# Altium project Portable_Guitar_MultiFX.PrjPcb
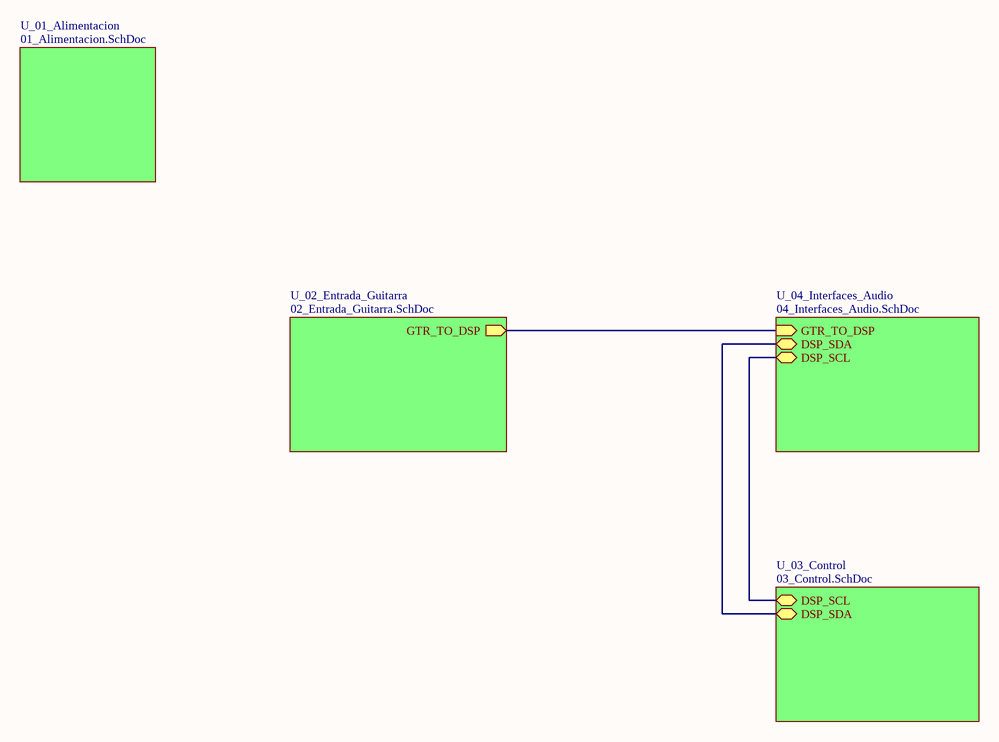
[diagram p0: 00_main.SchDoc]
5 sheets, 67 parts. Net scope: hierarchical (ports join the sheet entries above them; power ports are global).
Board file: Portable_Guitar_MultiFX.PcbDoc
Sheets:
  00_main.SchDoc
    U_02_Entrada_Guitarra = 02_Entrada_Guitarra.SchDoc
    U_04_Interfaces_Audio = 04_Interfaces_Audio.SchDoc
    U_03_Control = 03_Control.SchDoc
    U_01_Alimentacion = 01_Alimentacion.SchDoc

## Sheet 00_main.SchDoc: Portable_Guitar_MultiFX
size A4; Author: Javier Estiven Leon Calderon; Organization: Altium Limited; Address1: L3, 12a Rodborough Rd; Address2: Frenchs Forest; Address3: NSW; Address4: Australia 2086; DocumentNumber: 1; Revision: 1.0; SheetNumber: 1; SheetTotal: 5

### Sub-sheets
U_01_Alimentacion = 01_Alimentacion.SchDoc: no entries
U_02_Entrada_Guitarra = 02_Entrada_Guitarra.SchDoc: GTR_TO_DSP (out)
U_03_Control = 03_Control.SchDoc: DSP_SCL (bidir), DSP_SDA (bidir)
U_04_Interfaces_Audio = 04_Interfaces_Audio.SchDoc: GTR_TO_DSP (in), DSP_SDA (bidir), DSP_SCL (bidir)

### Nets
NetC8_2: sheet U_02_Entrada_Guitarra/GTR_TO_DSP, sheet U_04_Interfaces_Audio/GTR_TO_DSP
NetJP4_2: sheet U_04_Interfaces_Audio/DSP_SCL, sheet U_03_Control/DSP_SCL
NetJP5_2: sheet U_04_Interfaces_Audio/DSP_SDA, sheet U_03_Control/DSP_SDA

### Notes on the sheet
- Title
- Size:
- Date:
- A4
- Number:
- Time:
- Revision:
- Sheet
- of
- File:

## Sheet 02_Entrada_Guitarra.SchDoc: Portable_Guitar_MultiFX
size A4; Organization: Altium Limited; Address1: L3, 12a Rodborough Rd; Address2: Frenchs Forest; Address3: NSW; Address4: Australia 2086; DocumentNumber: 1; Revision: 1.0; SheetNumber: 3; SheetTotal: 5; SPICEModelCachePUIILNWP: <root> / <DocumentId>PUIILNWP</DocumentId> / <CacheFrame Number="0"> / <Model Name="mcp6001" Kind="CKT"> / <Text>.SUBCKT MCP6001 1 2 3 4 5 / *               | | | | | / *               | | | | Output / *               | | | Negative Supply / *               | | Positive Supply / *               | Inverting Input / *               Non-inverting Input / * / ******************************************************************************** / * Software License Agreement                                                   * / *                                                                              * / * The software supplied herewith by Microchip Technology Incorporated (the     * / * "Company") is intended and supplied to you, the Company's customer, for use  * / * soley and exclusively on Microchip products.                                 * / *                                                                              * / * The software is owned by the Company and/or its supplier, and is protected   * / * under applicable copyright laws. All rights are reserved. Any use in         * / * violation of the foregoing restrictions may subject the user to criminal     * / * sanctions under applicable laws, as well as to civil liability for the       * / * breach of the terms and conditions of this license.                          * / *                                                                              * / * THIS SOFTWARE IS PROVIDED IN AN "AS IS" CONDITION. NO WARRANTIES, WHETHER    * / * EXPRESS, IMPLIED OR STATUTORY, INCLUDING, BUT NOT LIMITED TO, IMPLIED        * / * WARRANTIES OF MERCHANTABILITY AND FITNESS FOR A PARTICULAR PURPOSE APPLY TO  * / * THIS SOFTWARE. THE COMPANY SHALL NOT, IN ANY CIRCUMSTANCES, BE LIABLE FOR    * / * SPECIAL, INCIDENTAL OR CONSEQUENTIAL DAMAGES, FOR ANY REASON WHATSOEVER.     * / ******************************************************************************** / * / * Macromodel for the MCP6001/2/4 op amp family: / *   MCP6001, MCP6001R, MCP6001U, MCP6002, MCP6004 / * / * Revision History: / *   REV A: 21-Jun-02, Created model / *   REV B: 16-Jul-02, Improved output stage / *   REV C: 03-Jan-03, Added MCP6001 / *   REV D: 19-Aug-06, Added over temperature, improved output stage, / *                     fixed overdrive recovery time / *   REV E: 27-Jul-07, Updated output impedance for better model stability w/cap load / *   REV F: 09-Jul-12, Added MCP6001R, MCP6001U / * / * Recommendations: / *   Use PSPICE (other simulators may require translation) / *   For a quick, effective design, use a combination of: data sheet / *     specs, bench testing, and simulations with this macromodel / *   For high impedance circuits, set GMIN=100F in .OPTIONS / * / * Supported: / *   Typical performance for temperature range (-40 to 125) degrees Celsius / *   DC, AC, Transient, and Noise analyses. / *   Most specs, including: offsets, DC PSRR, DC CMRR, input impedance, / *     open loop gain, voltage ranges, supply current, ... , etc. / *   Temperature effects for Ibias, Iquiescent, Iout short circuit / *   current, Vsat on both rails, Slew Rate vs. Temp and P.S. / * / * Not Supported: / *   Some Variation in specs vs. Power Supply Voltage / *   Monte Carlo (Vos, Ib), Process variation / *   Distortion (detailed non-linear behavior) / *   Behavior outside normal operating region / * / * Input Stage / V10  3 10 -500M / R10 10 11 6.90K / R11 10 12 6.90K / C11 11 12 0.2p / C12 1  0 6.00P / E12 71 14 POLY(4) 20 0 21 0 26 0 27 0   1.00M 20.1 20.1 1 1 / G12 1 0 62 0 1m / M12 11 14 15 15 NMI L=2.00U W=42.0U / M14 12  2 15 15 NMI L=2.00U W=42.0U / G14 2 0 62 0 1m / C14  2  0 6.00P / I15 15  4 50.0U / V16 16  4 -300M / GD16 16 1 TABLE {V(16,1)} ((-100,-1p)(0,0)(1m,1n)(2m,1m)(3m,1)) / V13  3 13 -300M / GD13 2 13 TABLE {V(2,13)} ((-100,-1p)(0,0)(1m,1n)(2m,1m)(3m,1)) / R70 1 0 20.6T / R71 2 0 20.6T / R72 1 2 20T / I80 1 2 0.5p / * / * Noise, PSRR, and CMRR / I20 21 20 423U / D20 20  0 DN1 / D21  0 21 DN1 / G26  0 26 POLY(1) 3 4   110U -49U / R26 26  0 1 / G27  0 27 POLY(2) 1 0 2 0   -440U 39.7U 39.7U / R27 27  0 1 / * / * Open Loop Gain, Slew Rate / G30  0 30 POLY(1) 12 11   0 1 / R30 30  0 1K / G31  0 31 POLY(1) 3 4 86 5.25 / R31 31  0 1 TC=2.8m / GD31 30 31 TABLE {V(30,31)} ((-11,-1)(-10,-10n)(0,0)(1m,1000)) / G32 32  0 POLY(1) 3 4 113.7 3.5 / R32 32  0 1 TC=2.65m / GD32 30 32 TABLE {V(30,32)} ((-1m,-1000)(0,0)(10,10n)(11,1)) / G33 0 33 30 0 1m / R33 33 0 1k / G34  0 34 33 0 425M / R34  34 0 1K / C34  34 0 74U / G37  0 37 34 0 1m / R37  37 0 1K / C37  37 0 41.6P / G38  0 38 37 0 1m / R38  39 0 1K / L38  38 39 100U / E38  35 0 38 0 1 / G35 33 0 TABLE {V(35,3)} ((-1,-1n)(0,0)(16,1n))(16.1,1)) / G36 33 0 TABLE {V(35,4)} ((-16.1,-1)((-16,-1n)(0,0)(1,1n)) / * / * Output Stage / R80 50 0 100MEG / G50 0 50 57 96 2 / R58 57  96 0.50 / R57 57  0 750 / C58  5  0 2.00P / G57  0 57 POLY(3) 3 0 4 0 35 0   0 0.67M 0.67M 1.5M / GD55 55 57 TABLE {V(55,57)} ((-2m,-1)(-1m,-1m)(0,0)(10,1n)) / GD56 57 56 TABLE {V(57,56)} ((-2m,-1)(-1m,-1m)(0,0)(10,1n)) / E55 55  0 POLY(2) 3 0 51 0 -0.7m 1 -40.0M / E56 56  0 POLY(2) 4 0 52 0 1.2m 1 -37.0M / R51 51 0 1k / R52 52 0 1k / GD51 50 51 TABLE {V(50,51)} ((-10,-1n)(0,0)(1m,1m)(2m,1)) / GD52 50 52 TABLE {V(50,52)} ((-2m,-1)(-1m,-1m)(0,0)(10,1n)) / G53  3  0 POLY(1) 51 0  -49U 1M / G54  0  4 POLY(1) 52 0  -49U -1M / * / * Current Limit / G99 96 5 99 0 1 / R98 0 98 1 TC=-2.8M,2.63U / G97 0 98 TABLE { V(96,5) } ((-11.0,-10.0M)(-1.00M,-9.9M)(0,0)(1.00M,9.9M)(11.0,10.0M)) / E97 99 0 VALUE { V(98)*((V(3)-V(4))*359M + 310M)} / D98 4 5 DESD / D99 5 3 DESD / * / * Temperature / Voltage Sensitive IQuiscent / R61 0 61 100 TC 3.11M 4.51U / G61 3 4 61 0 1 / G60 0 61 TABLE {V(3, 4)} / + ((0,0)(900M,0.0106U)(1.00,0.20U)(1.3,0.63U) / + (1.5,0.66U)(1.6,1.06U)(5.5,1.10U)) / * / * Temp Sensitive offset voltage / I73 0 70 DC 1uA / R74 0 70 1 TC=2 / E75 1 71 70 0 1 / * / * Temp Sensistive IBias / I62 0 62 DC 1uA / R62 0 62 REXP 58.2u / * Voltage on R62 used for G12, G14 in input stage / * / * Models / .MODEL NMI NMOS / .MODEL DESD  D   N=1 IS=1.00E-15 / .MODEL DL  D   N=1 IS=1F / .MODEL DN1 D   IS=1P KF=146E-18 AF=1 / .MODEL REXP RES TCE=10.1 / .ENDS MCP6001</Text> / </Model> / </CacheFrame> / </root>
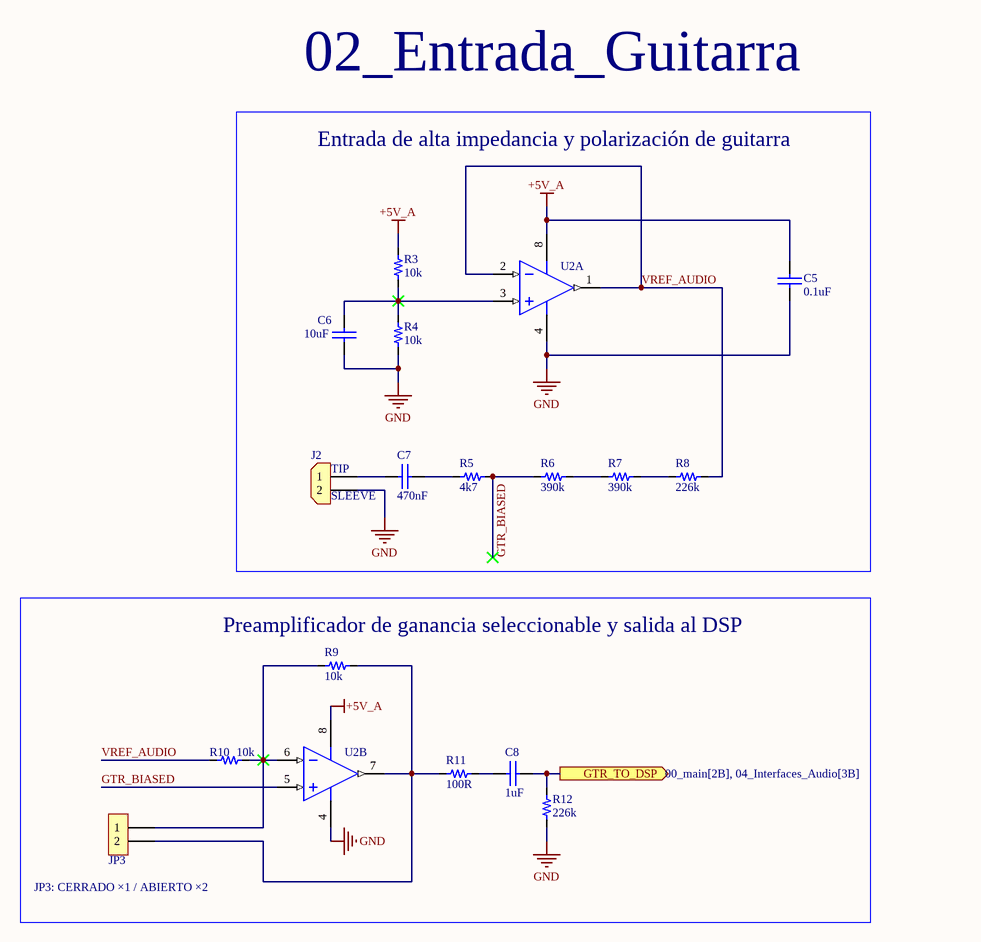
[diagram p1: 02_Entrada_Guitarra.SchDoc]

### Parts
C5  value 0.1uF  [0603_cap]  (hidden comment: 0.1uF 50V)
C6  value 10uF  [0805_cap]  (hidden comment: 10uF 25V)
C7  value 470nF  [0603_cap]  (hidden comment: 470nF 50V)
C8  value 1uF  [0603_cap]  (hidden comment: 1uF 50V)
J2  Connector 2pos  [CON_2x1_TH_5MM]  (value not drawn)
JP3  2x1  [H_2x1_TH_100mil]  (value not drawn)  (no BOM)
R3  value 10k  [0603_res]  (hidden comment: 10k 1/10W)
R4  value 10k  [0603_res]  (hidden comment: 10k 1/10W)
R5  value 4k7  [0603_res]  (hidden comment: 4k7 1/10W)
R6  value 390k  [0603_res]  (hidden comment: 390k 1/10W)
R7  value 390k  [0603_res]  (hidden comment: 390k 1/10W)
R8  value 226k  [0603_res]  (hidden comment: 226k 1/10W)
R9  value 10k  [0603_res]  (hidden comment: 10k 1/10W)
R10  value 10k  [0603_res]  (hidden comment: 10k 1/10W)
R11  value 100R  [0603_res]  (hidden comment: 100R 1/10W)
R12  value 226k  [0603_res]  (hidden comment: 226k 1/10W)
U2  MCP6002-I/P  [PDIP300-P8]  (value not drawn)  (parts A,B of 2)

### Blocks framed on the sheet
Entrada de alta impedancia y polarización de guitarra: C5-C7 J2 R3-R8 U2
Preamplificador de ganancia seleccionable y salida al DSP: C8 JP3 R9-R12 U2

### Ports
GTR_TO_DSP (out, see 00_main[2B], 04_Interfaces_Audio[3B])

### Nets
+5V_A: C5.1 R3.2 U2.8(VDD)
GND: C5.2 C6.2 J2.2 R4.1 R12.1 U2.4(VSS)
GTR_BIASED: R5.2 R6.1 U2.5(VINB+)
VREF_AUDIO: R8.2 R10.1 U2.1(VOUTA) U2.2(VINA-)
NetC6_1: C6.1 R3.1 R4.2 U2.3(VINA+)
NetC7_1: C7.1 J2.1
NetC7_2: C7.2 R5.1
NetC8_1: C8.1 R11.2
NetC8_2: C8.2 R12.2 ; port GTR_TO_DSP
NetJP3_1: JP3.1 R9.1 R10.2 U2.6(VINB-)
NetJP3_2: JP3.2 R9.2 R11.1 U2.7(VOUTB)
NetR6_2: R6.2 R7.1
NetR7_2: R7.2 R8.1

### Notes on the sheet
- 02_Entrada_Guitarra
- (near J2) TIP
- (near J2) SLEEVE
- (near JP3) JP3: CERRADO ×1 / ABIERTO ×2
- Title
- Size:
- Date:
- A4
- Number:
- Time:
- Revision:
- Sheet
- of
- File:

### Library data of the parts
C5 = Cap_0.1uF_0603_50V: 50V 100nF Y5V -20%~+80% 0603 Multilayer Ceramic Capacitors MLCC - SMD/SMT ROHS; Manufacturer: Walsin Tech Corp; Manufacturer Part Number: 0603F104Z500CT; Supplier 1: LCSC; Supplier Part Number 1: C83060; ComponentLink1Description: LCSC; ComponentLink1URL: https://www.lcsc.com/product-detail/Multilayer-Ceramic-Capacitors-MLCC-SMD-SMT_Walsin-Tech-Corp-0603F104Z500CT_C83060.html
C6 = Cap_10uF_0805_25V_: 25V 10uF X5R ±10% 0805 Multilayer Ceramic Capacitors MLCC - SMD/SMT ROHS; Manufacturer: Samsung Electro-Mechanics; Manufacturer Part Number: CL21A106KAYNNNE; Supplier 1: LCSC; Supplier Part Number 1: C15850; ComponentLink1Description: LCSC; ComponentLink1URL: https://lcsc.com/product-detail/Multilayer-Ceramic-Capacitors-MLCC-SMD-SMT_Samsung-Electro-Mechanics-CL21A106KAYNNNE_C15850.html
C7 = Cap_470nF_0603_50V: 50V 470nF X7R ±10% 0603 Multilayer Ceramic Capacitors MLCC - SMD/SMT ROHS; Manufacturer: Chinocera; Manufacturer Part Number: HGC0603R7474K500NTHJ; Supplier 1: LCSC; Supplier Part Number 1: C33546006; ComponentLink1Description: LCSC; ComponentLink1URL: https://lcsc.com/product-detail/Multilayer-Ceramic-Capacitors-MLCC-SMD-SMT_Chinocera-HGC0603R7474K500NTHJ_C33546006.html
C8 = Cap_1uF_0603_50V: 50V 1uF X5R ±10% 0603 Multilayer Ceramic Capacitors MLCC - SMD/SMT ROHS; Manufacturer: Samsung Electro-Mechanics; Manufacturer Part Number: CL10A105KB8NNNC; Supplier 1: LCSC; Supplier Part Number 1: C15849; ComponentLink1Description: LCSC; ComponentLink1URL: https://www.lcsc.com/product-detail/Multilayer-Ceramic-Capacitors-MLCC-SMD-SMT_Samsung-Electro-Mechanics-CL10A105KB8NNNC_C15849.html
J2 = Con_2x1_TH_5mm: 2POS 5MM; Manufacturer: JILN; Manufacturer Part Number: JL126-50002G01; Supplier 1: LCSC; Supplier Part Number 1: C394556; ComponentLink1Description: Digi-Key; ComponentLink1URL: https://www.lcsc.com/product-detail/Screw-terminal_JILN-JL126-50002G01_C394556.html
JP3 = H_Male_2x1_TH_100mil: ComponentLink1Description: LCSC
R3 R4 R9 R10 = Res_10k_0603_1/10W: RES SMD 10k OHM 5% 1/10W 0603; Manufacturer: FOJAN; Manufacturer Part Number: FRC0603J103TS; ComponentLink1URL: https://www.lcsc.com/product-detail/Chip-Resistor-Surface-Mount_FOJAN-FRC0603J103TS_C2930027.html; Supplier 1: LCSC; Supplier Part Number 1: C2930027; ComponentLink1Description: LCSC
R5 = Res_4k7_0603_1/10W: 100mW Thick Film Resistor 75V ±1% 4.7kΩ 0603 Chip Resistor - Surface Mount ROHS; Manufacturer: VO; Manufacturer Part Number: SCR0603F4K7; ComponentLink1URL: https://lcsc.com/product-detail/Chip-Resistor-Surface-Mount_VO-SCR0603F4K7_C3016318.html; Supplier 1: LCSC; Supplier Part Number 1: C3016318; ComponentLink1Description: LCSC
R6 R7 = Res_390k_0603_1/10W: 100mW Thick Film Resistor 75V ±100ppm/℃ ±1% 390kΩ 0603 Chip Resistor - Surface Mount ROHS; Manufacturer: YAGEO; Manufacturer Part Number: RC0603FR-07390KL; ComponentLink1URL: https://lcsc.com/product-detail/Chip-Resistor-Surface-Mount_YAGEO-RC0603FR-07390KL_C137735.html; Supplier 1: LCSC; Supplier Part Number 1: C137735; ComponentLink1Description: LCSC
R8 R12 = Res_226k_0603_1/10W: 100mW Thick Film Resistors 75V ±100ppm/℃ ±1% 226kΩ 0603 Chip Resistor - Surface Mount ROHS; Manufacturer: YAGEO; Manufacturer Part Number: RC0603FR-07226KL; ComponentLink1URL: https://lcsc.com/product-detail/Chip-Resistor-Surface-Mount_YAGEO-RC0603FR-07226KL_C165744.html; Supplier 1: LCSC; Supplier Part Number 1: C165744; ComponentLink1Description: LCSC
R11 = Res_100R_0603_1/10W: RES SMD 100R OHM 5% 1/10W 0603; Manufacturer: FOJAN; Manufacturer Part Number: FRC0603J101 TS; ComponentLink1URL: https://www.lcsc.com/product-detail/Chip-Resistor-Surface-Mount_FOJAN-FRC0603J101-TS_C2907089.html; Supplier 1: LCSC; Supplier Part Number 1: C2907089; ComponentLink1Description: LCSC
U2 = CMP-0187-00119-3: None; Max Frequency: 1kHz; Operating Supply Current: 100uA; Amplifier Type: GENERAL PURPOSE; Number of Channels: 2; Power Supply Rejection Ratio (PSRR): 86dB; Max Input Voltage: 6V; Bandwidth: 1MHz; Voltage Gain: 112dB; Input Bias Current: 1pA; Slew Rate-Nom: 0.6V/µs; Output Current: 23mA; Input Offset Voltage-Max: 4.5mV; Common Mode Rejection Ratio: 60dB; Min Input Voltage: 1.8V; Operating Supply Voltage: 5.5V; Height: 0.195inch; Number of Circuits: 2; REACH SVHC: No SVHC; Max Supply Voltage: 6V; Supply Current: 100uA; Gain Bandwidth Product: 1MHz; Radiation Hardening: No; Mount: Through Hole; Length: 0.4inch; Number of Pins: 8; Min Operating Temperature: -40°C; Case/Package: PDIP; Number of Amplifiers: 2; RoHS Compliant: Yes; Lead Free: Lead Free; Number of Elements: 2; Technology: CMOS; Width: 0.28inch; Slew Rate: 0.6V/µs; Packaging: Rail/Tube; Output Current per Channel: 23mA; Max Operating Temperature: 85°C; Nominal Supply Current: 100uA; Min Supply Voltage: 1.8V; Input Offset Voltage (Vos): 4.5mV; Unity Gain Bandwidth Product: 1MHz; Package Quantity: 60

## Sheet 04_Interfaces_Audio.SchDoc: Portable_Guitar_MultiFX
size A4; Organization: Altium Limited; Address1: L3, 12a Rodborough Rd; Address2: Frenchs Forest; Address3: NSW; Address4: Australia 2086; DocumentNumber: 1; SheetNumber: 5; SheetTotal: 5
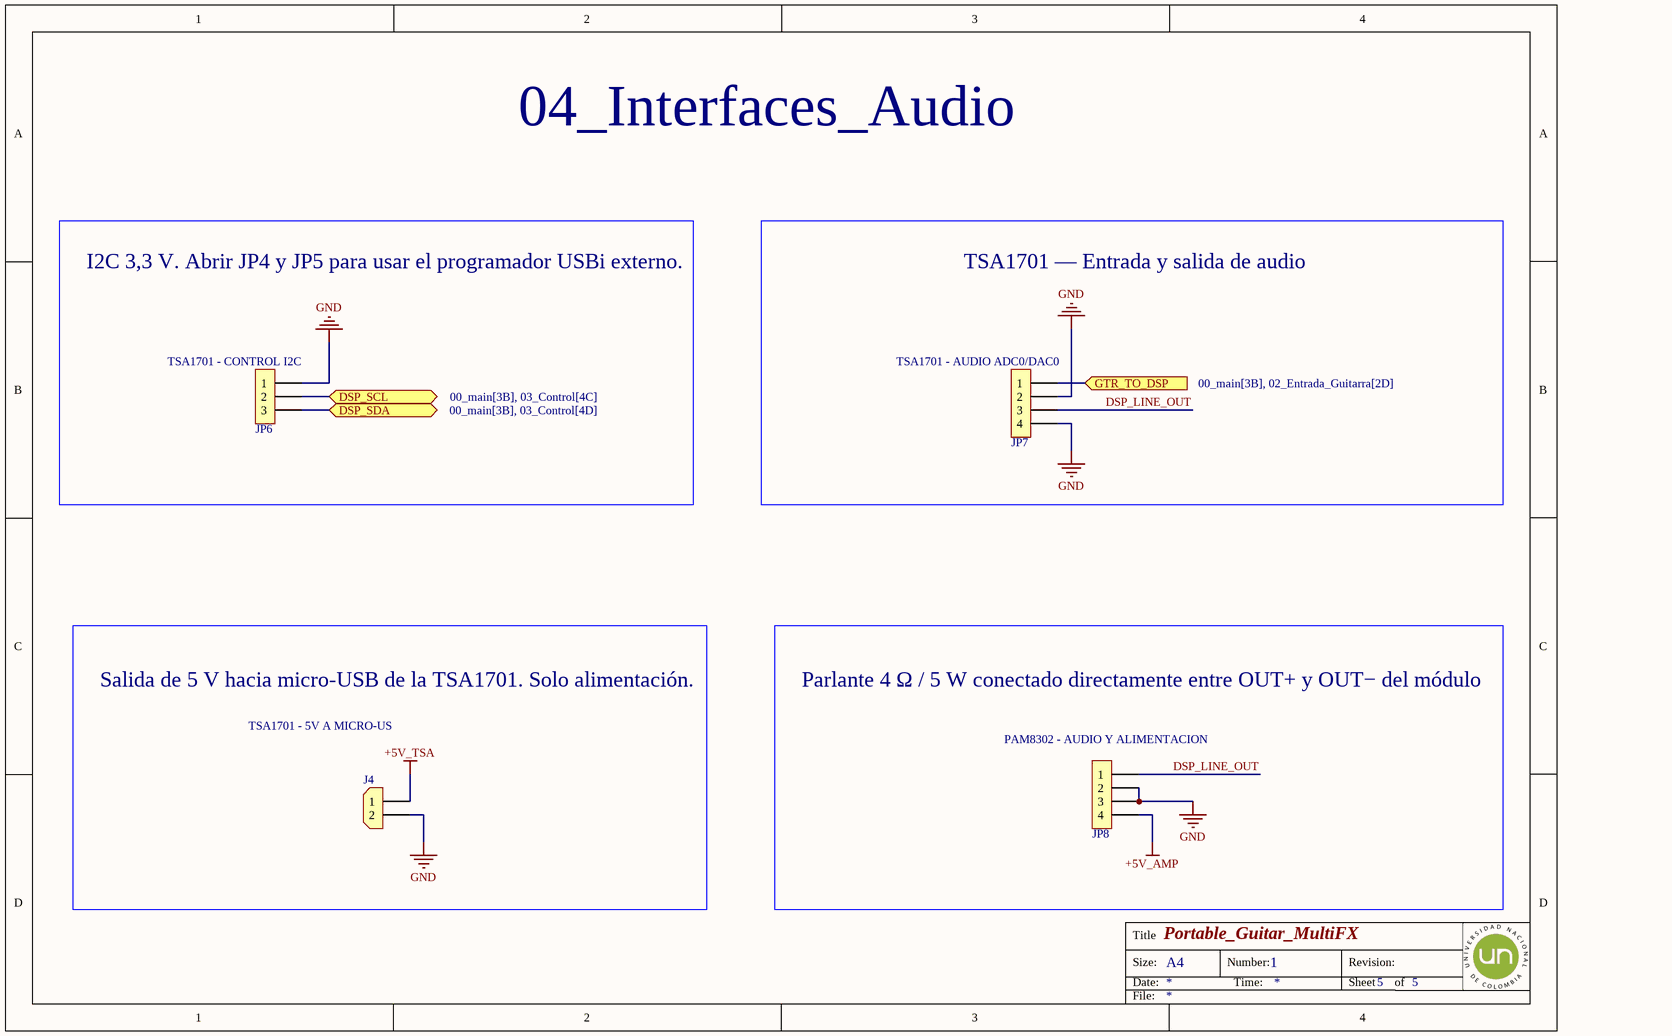
[diagram p2: 04_Interfaces_Audio.SchDoc]

### Parts
J4  TSA1701 - 5V A MICRO-US  [CON_2x1_TH_2MM]
JP6  TSA1701 - CONTROL I2C  [H_3X1_TH_100mil]  (no BOM)
JP7  TSA1701 - AUDIO ADC0/DAC0  [H_4x1_TH_2.54mm]  (no BOM)
JP8  PAM8302 - AUDIO Y ALIMENTACION  [H_4x1_TH_2.54mm]  (no BOM)

### Blocks framed on the sheet
TSA1701 — Entrada y salida de audio: JP7

### Ports
DSP_SCL (bidir, see 00_main[3B], 03_Control[4C]), DSP_SDA (bidir, see 00_main[3B], 03_Control[4D]), GTR_TO_DSP (in, see 00_main[3B], 02_Entrada_Guitarra[2D])

### Nets
+5V_AMP: JP8.4
+5V_TSA: J4.1
GND: J4.2 JP6.1 JP7.2 JP7.4 JP8.2 JP8.3
DSP_LINE_OUT: JP7.3 JP8.1
NetC8_2: JP7.1 ; port GTR_TO_DSP
NetJP4_2: JP6.2 ; port DSP_SCL
NetJP5_2: JP6.3 ; port DSP_SDA

### Notes on the sheet
- 04_Interfaces_Audio
- I2C 3,3 V. Abrir JP4 y JP5 para usar el programador USBi externo.
- Salida de 5 V hacia micro-USB de la TSA1701. Solo alimentación.
- Parlante 4 Ω / 5 W conectado directamente entre OUT+ y OUT− del módulo
- Title
- Size:
- Date:
- A4
- Number:
- Time:
- Revision:
- Sheet
- of
- File:

### Library data of the parts
J4 = Con_2x1_TH_JST_2MM: 2POS 2MM; Manufacturer: JST; Manufacturer Part Number: S2B-PH-K-S(LF)(SN); Supplier 1: LCSC; Supplier Part Number 1: C173752; ComponentLink1Description: Digi-Key; ComponentLink1URL: https://lcsc.com/product-detail/Wire-To-Board-Connector_JST-S2B-PH-K-S-LF-SN_C173752.html
JP6 = H_Male_3x1_TH_100mil: ComponentLink1Description: LCSC
JP7 JP8 = H_Male_4x1_TH_100mil: ComponentLink1Description: LCSC

## Sheet 03_Control.SchDoc: Portable_Guitar_MultiFX
size 420 x 297 mm; Organization: Altium Limited; Address1: L3, 12a Rodborough Rd; Address2: Frenchs Forest; Address3: NSW; Address4: Australia 2086; DocumentNumber: 1; Revision: 1.0; SheetNumber: 4; SheetTotal: 5
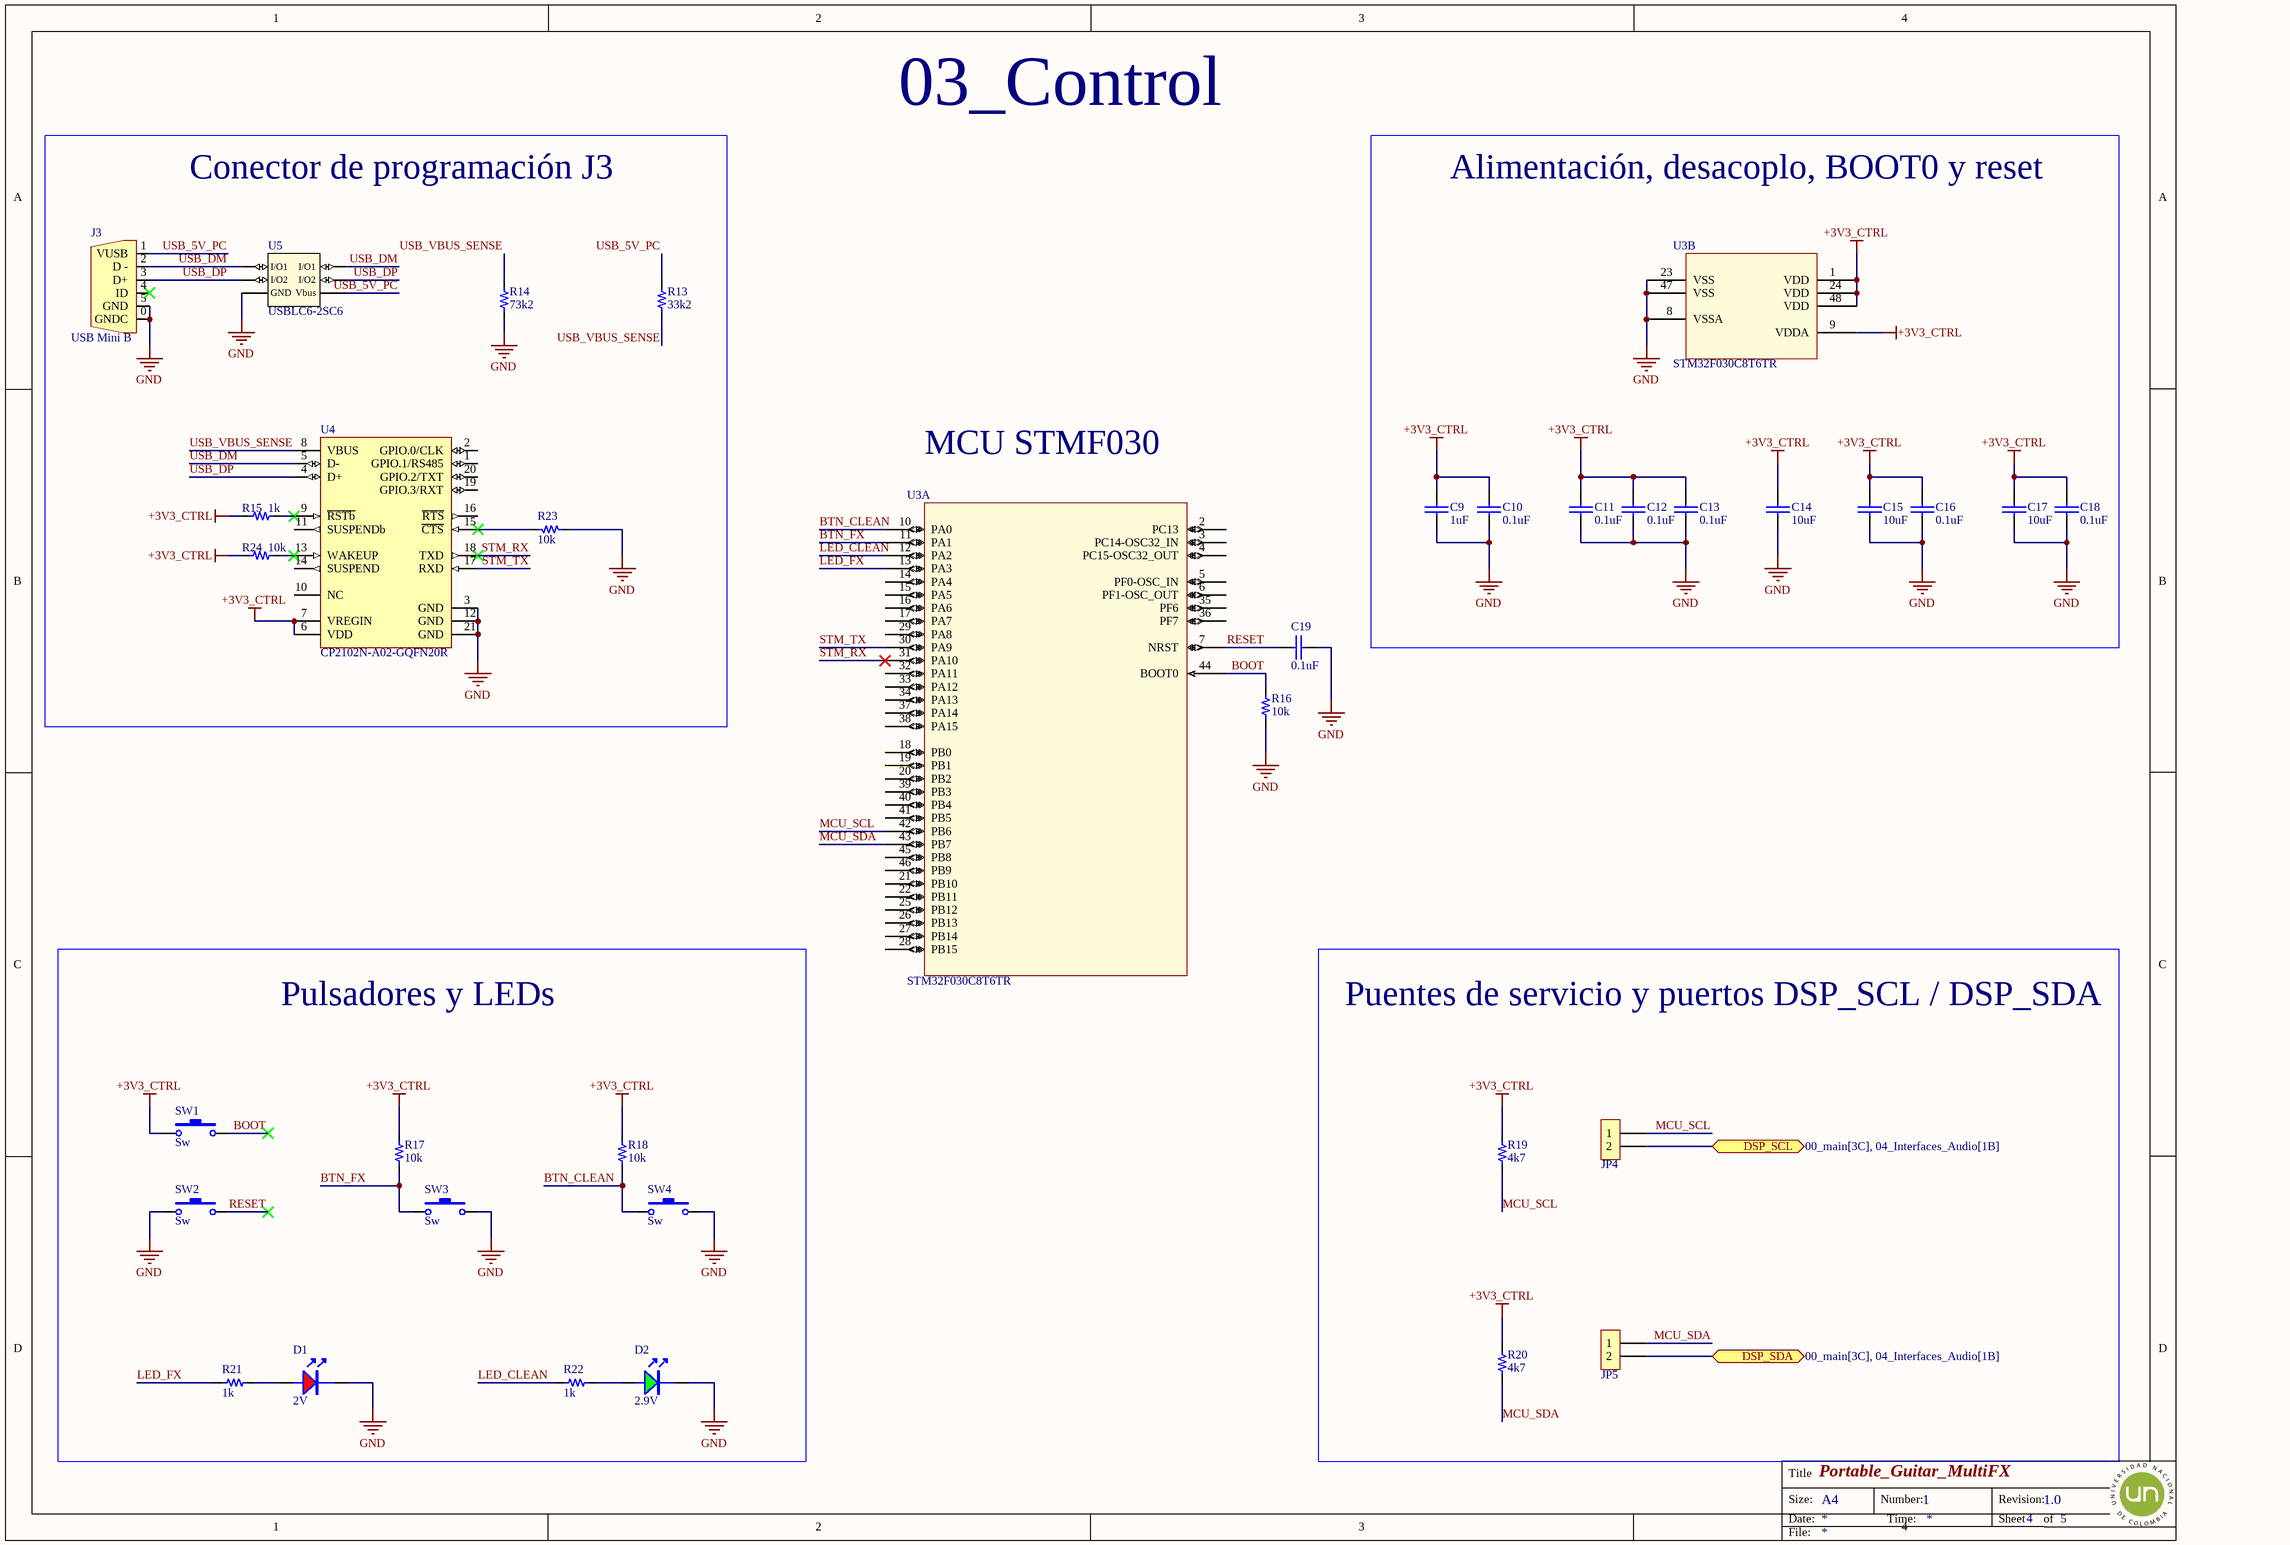
[diagram p3: 03_Control.SchDoc]

### Parts
C9  value 1uF  [0603_cap]  (hidden comment: 1uF 50V)
C10  value 0.1uF  [0603_cap]  (hidden comment: 0.1uF 50V)
C11  value 0.1uF  [0603_cap]  (hidden comment: 0.1uF 50V)
C12  value 0.1uF  [0603_cap]  (hidden comment: 0.1uF 50V)
C13  value 0.1uF  [0603_cap]  (hidden comment: 0.1uF 50V)
C14  value 10uF  [0603_cap]  (hidden comment: 10uF 10V)
C15  value 10uF  [0603_cap]  (hidden comment: 10uF 10V)
C16  value 0.1uF  [0603_cap]  (hidden comment: 0.1uF 50V)
C17  value 10uF  [0603_cap]  (hidden comment: 10uF 10V)
C18  value 0.1uF  [0603_cap]  (hidden comment: 0.1uF 50V)
C19  value 0.1uF  [0603_cap]  (hidden comment: 0.1uF 50V)
D1  2V  [0805_LED]
D2  2.9V  [0805_LED]
J3  USB Mini B  [CON_5x1_SMD_miniUSB_B]
JP4  2x1  [H_2x1_TH_100mil]  (value not drawn)  (no BOM)
JP5  2x1  [H_2x1_TH_100mil]  (value not drawn)  (no BOM)
R13  value 33k2  [0603_res]  (hidden comment: 33k2 1/10W)
R14  value 73k2  [0603_res]  (hidden comment: 73k2 1/10W)
R15  value 1k  [0603_res]  (hidden comment: 1k 1/10W)
R16  value 10k  [0603_res]  (hidden comment: 10k 1/10W)
R17  value 10k  [0603_res]  (hidden comment: 10k 1/10W)
R18  value 10k  [0603_res]  (hidden comment: 10k 1/10W)
R19  value 4k7  [0603_res]  (hidden comment: 4k7 1/10W)
R20  value 4k7  [0603_res]  (hidden comment: 4k7 1/10W)
R21  value 1k  [0603_res]  (hidden comment: 1k 1/10W)
R22  value 1k  [0603_res]  (hidden comment: 1k 1/10W)
R23  value 10k  [0603_res]  (hidden comment: 10k 1/10W)
R24  value 10k  [0603_res]  (hidden comment: 10k 1/10W)
SW1  Sw  [Sw_PUSH_4.5x4.5x5mm]
SW2  Sw  [Sw_PUSH_4.5x4.5x5mm]
SW3  Sw  [Sw_PUSH_4.5x4.5x5mm]
SW4  Sw  [Sw_PUSH_4.5x4.5x5mm]
U3  STM32F030C8T6TR  [LQFP48_7x7mm]  (parts A,B of 2)
U4  CP2102N-A02-GQFN20R  [WFQFN_20_EP_3X3MM]
U5  USBLC6-2SC6  [SOT_23_6]

### Blocks framed on the sheet
Conector de programación J3: J3 R13-R15 R23 R24 U4 U5
Alimentación, desacoplo, BOOT0 y reset: C9-C18 U3
Pulsadores y LEDs: D1 D2 R17 R18 R21 R22 SW1-SW4
Puentes de servicio y puertos DSP_SCL / DSP_SDA: JP4 JP5 R19 R20

### Ports
DSP_SCL (bidir, see 00_main[3C], 04_Interfaces_Audio[1B]), DSP_SDA (bidir, see 00_main[3C], 04_Interfaces_Audio[1B])

### Nets
+3V3_CTRL: C9.1 C10.1 C11.1 C12.2 C13.2 C14.1 C15.1 C16.1 C17.1 C18.1 R15.1 R17.2 R18.2 R19.2 R20.2 R24.1 SW1.1 U3.1(VDD) U3.9(VDDA) U3.24(VDD) U3.48(VDD) U4.6(VDD) U4.7(VREGIN)
GND: C9.2 C10.2 C11.2 C12.1 C13.1 C14.2 C15.2 C16.2 C17.2 C18.2 C19.2 D1.2 D2.2 J3.0(GNDC) J3.5(GND) R14.1 R16.1 R23.1 SW2.1 SW3.2 SW4.2 U3.8(VSSA) U3.23(VSS) U3.47(VSS) U4.3(GND) U4.12(GND) U4.21(GND) U5.2(GND)
BOOT: R16.2 SW1.2 U3.44(BOOT0)
BTN_CLEAN: R18.1 SW4.1 U3.10(PA0)
BTN_FX: R17.1 SW3.1 U3.11(PA1)
LED_CLEAN: R22.1 U3.12(PA2)
LED_FX: R21.1 U3.13(PA3)
MCU_SCL: JP4.1 R19.1 U3.42(PB6)
MCU_SDA: JP5.1 R20.1 U3.43(PB7)
RESET: C19.1 SW2.2 U3.7(NRST)
STM_RX: U3.31(PA10) U4.18(TXD)
STM_TX: U3.30(PA9) U4.17(RXD)
USB_5V_PC: J3.1(VUSB) R13.2 U5.5(Vbus)
USB_DM: J3.2(D_-) U4.5(D-) U5.1(I/O1) U5.6(I/O1)
USB_DP: J3.3(D+) U4.4(D+) U5.3(I/O2) U5.4(I/O2)
USB_VBUS_SENSE: R13.1 R14.2 U4.8(VBUS)
NetD1_1: D1.1(A) R21.2
NetD2_1: D2.1(A) R22.2
NetJP4_2: JP4.2 ; port DSP_SCL
NetJP5_2: JP5.2 ; port DSP_SDA
NetR15_2: R15.2 U4.9(~{RSTb})
NetR23_2: R23.2 U4.15(~{CTS})
NetR24_2: R24.2 U4.13(WAKEUP)

Not connected (* = marked no-connect by the designer): J3 4(ID)*; U3 2(PC13) 3(PC14-OSC32_IN) 4(PC15-OSC32_OUT) 5(PF0-OSC_IN) 6(PF1-OSC_OUT) 14(PA4) 15(PA5) 16(PA6) 17(PA7) 18(PB0) 19(PB1) 20(PB2) 21(PB10) 22(PB11) 25(PB12) 26(PB13) 27(PB14) 28(PB15) 29(PA8) 32(PA11) 33(PA12) 34(PA13) 35(PF6) 36(PF7) 37(PA14) 38(PA15) 39(PB3) 40(PB4) 41(PB5) 45(PB8) 46(PB9); U4 1(GPIO.1/RS485) 2(GPIO.0/CLK) 10(NC) 11(SUSPENDb) 14(SUSPEND) 16(~{RTS}) 19(GPIO.3/RXT) 20(GPIO.2/TXT)

### Notes on the sheet
- 03_Control
- MCU STMF030
- Title
- Size:
- Date:
- File:
- A4
- Number:
- Time:
- Revision:
- Sheet
- of

### Library data of the parts
C9 = Cap_1uF_0603_50V: as C8 on sheet 02_Entrada_Guitarra; Supplier 1: LCSC; Supplier Part Number 1: C15849; ComponentLink1Description: LCSC; ComponentLink1URL: https://www.lcsc.com/product-detail/Multilayer-Ceramic-Capacitors-MLCC-SMD-SMT_Samsung-Electro-Mechanics-CL10A105KB8NNNC_C15849.html
C10-C13 C16 C18 C19 = Cap_0.1uF_0603_50V: as C5 on sheet 02_Entrada_Guitarra; Supplier 1: LCSC; Supplier Part Number 1: C83060; ComponentLink1Description: LCSC; ComponentLink1URL: https://www.lcsc.com/product-detail/Multilayer-Ceramic-Capacitors-MLCC-SMD-SMT_Walsin-Tech-Corp-0603F104Z500CT_C83060.html
C14 C15 C17 = Cap_10uF_0603_10V: 10V 10uF X5R ±10% 0603 Multilayer Ceramic Capacitors MLCC - SMD/SMT ROHS; Manufacturer: CCTC; Manufacturer Part Number: TCC0603X5R106K100CT; Supplier 1: LCSC; Supplier Part Number 1: C380314; ComponentLink1Description: LCSC; ComponentLink1URL: https://www.lcsc.com/product-detail/Multilayer-Ceramic-Capacitors-MLCC-SMD-SMT_CCTC-TCC0603X5R106K100CT_C380314.html
D1 = LED_0805_RED: LED RED CLEAR 0805 SMD; Manufacturer: XINGLIGHT; Manufacturer Part Number: XL-2012SURC; Supplier 1: LCSC; Supplier Part Number 1: C965812; ComponentLink1Description: LCSC; ComponentLink1URL: https://www.lcsc.com/product-detail/Light-Emitting-Diodes-LED_XINGLIGHT-XL-2012SURC_C965812.html
D2 = LED_0805_Green: LED GREEN CLEAR 0805 SMD; Manufacturer: XINGLIGHT; Manufacturer Part Number: XL-2012UGC; Supplier 1: LCSC; Supplier Part Number 1: C965815; ComponentLink1Description: LCSC; ComponentLink1URL: https://www.lcsc.com/product-detail/Light-Emitting-Diodes-LED_XINGLIGHT-XL-2012UGC_C965815.html
J3 = Con_Mini_USB_B: CONN RCPT USB2.0 MINI B SMD R/A; Manufacturer Part Number: KH-MINI-SMT-5P-Cu; Manufacturer: EDAC Inc.; ComponentLink1Description: LCSC; ComponentLink1URL: https://datasheet.lcsc.com/lcsc/2106070035_Shenzhen-Kinghelm-Elec-KH-MINI-SMT-5P-Cu_C2688795.pdf; Supplier 1: LCSC; Supplier Part Number 1: C2688795
JP4 JP5 = H_Male_2x1_TH_100mil: ComponentLink1Description: LCSC
R13 = Res_33k2_0603_1/10W: 100mW Thick Film Resistor 75V ±100ppm/℃ ±1% 33.2kΩ 0603 Chip Resistor - Surface Mount ROHS; Manufacturer: YAGEO; Manufacturer Part Number: RC0603FR-0733K2L; ComponentLink1URL: https://lcsc.com/product-detail/Chip-Resistor-Surface-Mount_YAGEO-RC0603FR-0733K2L_C185338.html; Supplier 1: LCSC; Supplier Part Number 1: C185338; ComponentLink1Description: LCSC
R14 = Res_73k2_0603_1/10W: 100mW Thick Film Resistor 75V ±100ppm/℃ ±1% 73.2kΩ 0603 Chip Resistor - Surface Mount ROHS; Manufacturer: YAGEO; Manufacturer Part Number: RC0603FR-0773K2L; ComponentLink1URL: https://lcsc.com/product-detail/Chip-Resistor-Surface-Mount_YAGEO-RC0603FR-0773K2L_C163420.html; Supplier 1: LCSC; Supplier Part Number 1: C163420; ComponentLink1Description: LCSC
R15 R21 R22 = Res_1k_0603_1/10W: RES SMD 1k OHM 5% 1/10W 0603; Manufacturer: FOJAN; Manufacturer Part Number: FRC0603J102 TS; ComponentLink1URL: https://www.lcsc.com/product-detail/Chip-Resistor-Surface-Mount_FOJAN-FRC0603J102-TS_C2907113.html; Supplier 1: LCSC; Supplier Part Number 1: C2907113; ComponentLink1Description: LCSC
R16-R18 R23 R24 = Res_10k_0603_1/10W: as R3 on sheet 02_Entrada_Guitarra; ComponentLink1URL: https://www.lcsc.com/product-detail/Chip-Resistor-Surface-Mount_FOJAN-FRC0603J103TS_C2930027.html; Supplier 1: LCSC; Supplier Part Number 1: C2930027; ComponentLink1Description: LCSC
R19 R20 = Res_4k7_0603_1/10W: as R5 on sheet 02_Entrada_Guitarra; ComponentLink1URL: https://lcsc.com/product-detail/Chip-Resistor-Surface-Mount_VO-SCR0603F4K7_C3016318.html; Supplier 1: LCSC; Supplier Part Number 1: C3016318; ComponentLink1Description: LCSC
SW1-SW4 = Sw_PUSH_4.5x4.5x5.0xmm: SWITCH TACTILE SPST-NO 0.05A 12V; Manufacturer: BZCN; Manufacturer Part Number: TSC015A05026A; Supplier 1: LCSC; Supplier Part Number 1: C2888509; Last modified by: N-A.Potosi; Last modified date: 20190222; ComponentLink1Description: LCSC; ComponentLink1URL: https://www.lcsc.com/product-detail/Tactile-Switches_BZCN-TSC015A05026A_C2888509.html
U3 = IC_STM32F030C8T6TR_LQFP48_7x7MM: IC MCU 32BIT 64KB FLASH 48LQFP; Manufacturer: STMicroelectronics; Manufacturer part number: STM32F030C8T6TR; Supplier 1: LCSC; Supplier Part Number 1: C23922; ComponentLink1Description: LCSC; ComponentLink1URL: https://www.lcsc.com/product-detail/ST-Microelectronics_STMicroelectronics-STM32F030C8T6_C23922.html
U4 = IC_SGL_USB2UART-BRIDGE_20QFN: IC USB TO UART BRIDGE QFN20; Manufacturer: Silicon Labs; Manufacturer Part Number: CP2102N-A02-GQFN20R; Supplier 1: LCSC; Supplier Part Number 1: C969913; ComponentLink1Description: LCSC; ComponentLink1URL: https://www.lcsc.com/product-detail/USB-ICs_SILICON-LABS-CP2102N-A02-GQFN20R_C969913.html
U5 = TVS_5.25V_2CH_SOT_23_6: TVS DIODE 5.25V 17V SOT23-6; Manufacturer: STMicroelectronics; ComponentLink1Description: LCSC; ComponentLink1URL: https://www.lcsc.com/product-detail/ESD-Protection-Devices_STMicroelectronics-USBLC6-2SC6_C7519.html; Supplier 1: LCSC; Manufacturer Part Number: USBLC6-2SC6; Supplier Part Number 1: C7519

## Sheet 01_Alimentacion.SchDoc: Portable_Guitar_MultiFX
size A4; Organization: Altium Limited; Address1: L3, 12a Rodborough Rd; Address2: Frenchs Forest; Address3: NSW; Address4: Australia 2086; DocumentNumber: 1; Revision: 1.0; SheetNumber: 2; SheetTotal: 5
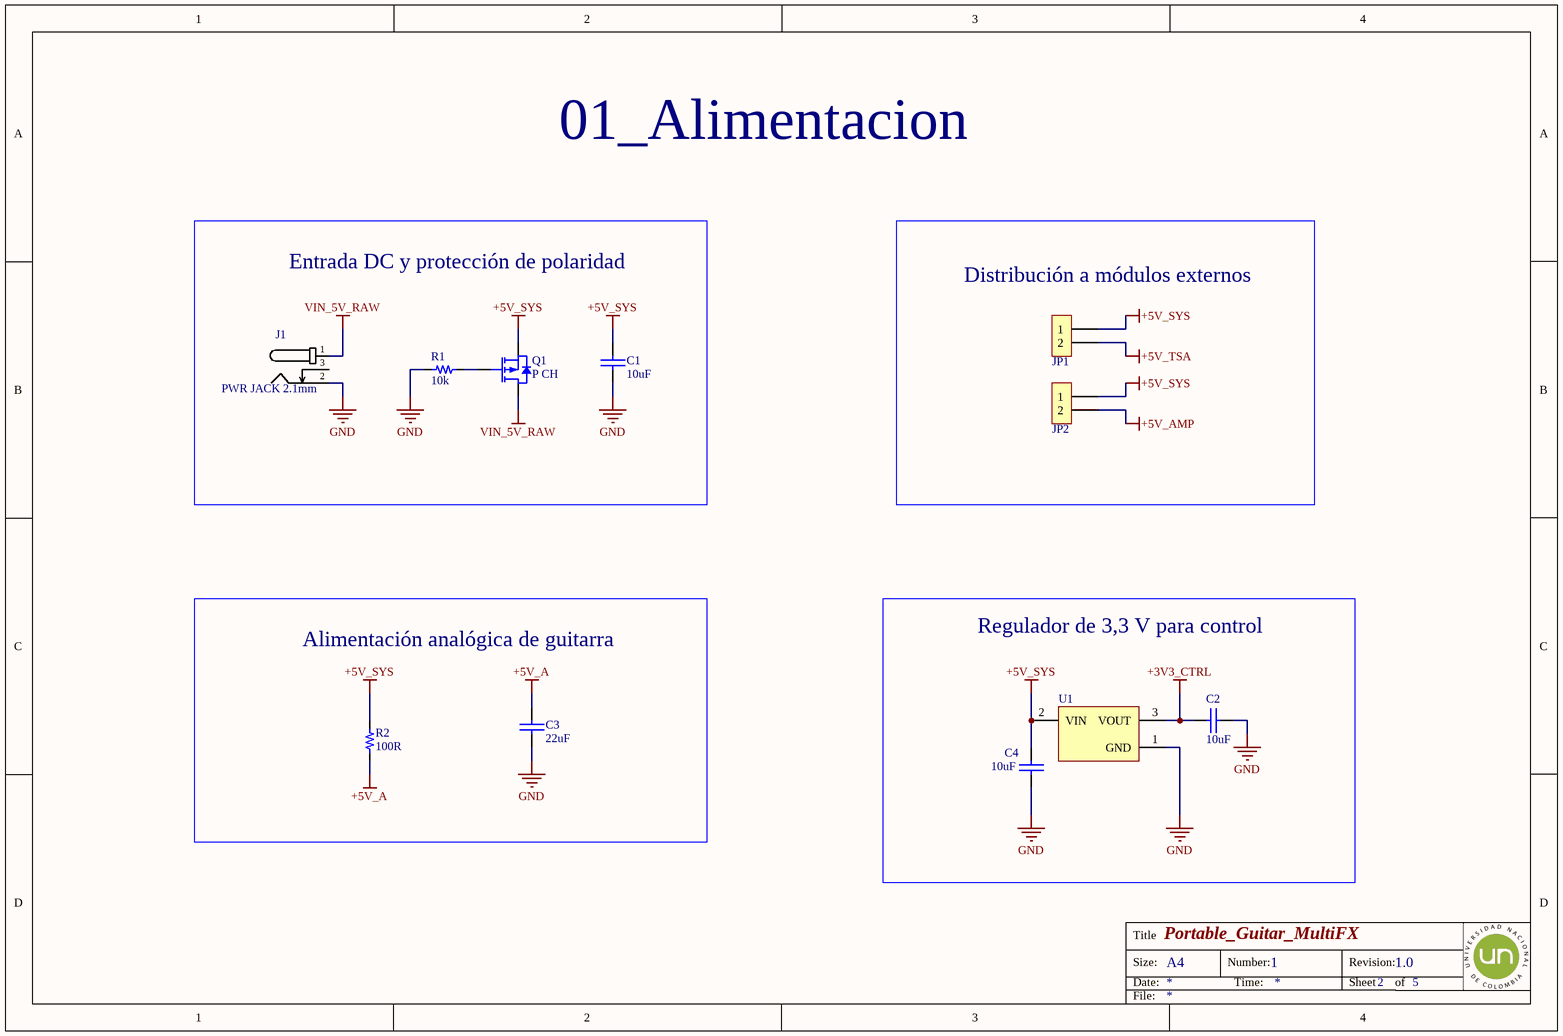
[diagram p4: 01_Alimentacion.SchDoc]

### Parts
C1  value 10uF  [0805_cap]  (hidden comment: 10uF 25V)
C2  value 10uF  [0805_cap]  (hidden comment: 10uF 25V)
C3  value 22uF  [0805_cap]  (hidden comment: 22uF 16V)
C4  value 10uF  [0805_cap]  (hidden comment: 10uF 25V)
J1  PWR JACK 2.1mm  [CON_POWER_BARREL_2.1MM_3CONN]
JP1  2x1  [H_2x1_TH_100mil]  (value not drawn)  (no BOM)
JP2  2x1  [H_2x1_TH_100mil]  (value not drawn)  (no BOM)
Q1  P CH  [SOT_23_3]
R1  value 10k  [0603_res]  (hidden comment: 10k 1/10W)
R2  value 100R  [0603_res]  (hidden comment: 100R 1/10W)
U1  MCP1700-3302E/TO  [TO-92-TO3]  (value not drawn)

### Blocks framed on the sheet
Entrada DC y protección de polaridad: C1 J1 Q1 R1
Distribución a módulos externos: JP1 JP2
Alimentación analógica de guitarra: C3 R2
Regulador de 3,3 V para control: C2 C4 U1

### Nets
+3V3_CTRL: C2.2 U1.3(VOUT)
+5V_A: C3.1 R2.1
+5V_AMP: JP2.2
+5V_SYS: C1.1 C4.2 JP1.1 JP2.1 Q1.2(S) R2.2 U1.2(VIN)
+5V_TSA: JP1.2
GND: C1.2 C2.1 C3.2 C4.1 J1.2 R1.1 U1.1(GND)
VIN_5V_RAW: J1.1 Q1.3(D)
NetQ1_1: Q1.1(G) R1.2

Not connected (* = marked no-connect by the designer): J1 3

### Notes on the sheet
- 01_Alimentacion
- Title
- Size:
- Date:
- A4
- Number:
- Time:
- Revision:
- Sheet
- of
- File:

### Library data of the parts
C1 C2 C4 = Cap_10uF_0805_25V_: as C6 on sheet 02_Entrada_Guitarra; Supplier 1: LCSC; Supplier Part Number 1: C15850; ComponentLink1Description: LCSC; ComponentLink1URL: https://lcsc.com/product-detail/Multilayer-Ceramic-Capacitors-MLCC-SMD-SMT_Samsung-Electro-Mechanics-CL21A106KAYNNNE_C15850.html
C3 = Cap_22uF_0805_16V: 16V 22uF X5R ±20% 0805 Multilayer Ceramic Capacitors MLCC - SMD/SMT ROHS; Manufacturer: Chinocera; Manufacturer Part Number: HGC0805R5226M160NSLJ; Supplier 1: LCSC; Supplier Part Number 1: C33546008; ComponentLink1Description: LCSC; ComponentLink1URL: https://lcsc.com/product-detail/Multilayer-Ceramic-Capacitors-MLCC-SMD-SMT_Chinocera-HGC0805R5226M160NSLJ_C33546008.html
J1 = Con_Power_Jack_2.1mm_3pins: CONN PWR JACK 2X5.5MM SOLDER; Manufacturer: HCTL; Manufacturer Part Number: HC-DC-005-2.0T; Supplier 1: LCSC; Supplier Part Number 1: C3010533; ComponentLink1Description: LCSC; ComponentLink1URL: https://www.lcsc.com/product-detail/AC-DC-Power-Connectors_HCTL-HC-DC-005-2-0T_C3010533.html
JP1 JP2 = H_Male_2x1_TH_100mil: ComponentLink1Description: LCSC
Q1 = Q_PFET_30V_3A_SOT23: MOSFET P-CH 20V 3A SOT23; Manufacturer: ALLPOWER(ShenZhen Quan Li Semiconductor); Manufacturer Part Number: AP2301; Supplier 1: LCSC; Supplier Part Number 1: C385296; ComponentLink1Description: LCSC; ComponentLink1URL: https://www.lcsc.com/product-detail/MOSFETs_ALLPOWER-ShenZhen-Quan-Li-Semiconductor-AP2301_C385296.html
R1 = Res_10k_0603_1/10W: as R3 on sheet 02_Entrada_Guitarra; ComponentLink1URL: https://www.lcsc.com/product-detail/Chip-Resistor-Surface-Mount_FOJAN-FRC0603J103TS_C2930027.html; Supplier 1: LCSC; Supplier Part Number 1: C2930027; ComponentLink1Description: LCSC
R2 = Res_100R_0603_1/10W: as R11 on sheet 02_Entrada_Guitarra; ComponentLink1URL: https://www.lcsc.com/product-detail/Chip-Resistor-Surface-Mount_FOJAN-FRC0603J101-TS_C2907089.html; Supplier 1: LCSC; Supplier Part Number 1: C2907089; ComponentLink1Description: LCSC
U1 = CMP-0136-00007-1: Low Quiescent Current LDO, 3-Pin TO-92, Extended TemperatureBAG; PackageReference: TO-92-TO3; PackageDescription: 3-Lead Plastic Transistor Outline (TO) [TO-92]; DatasheetVersion: revB, Feb-2007; PackageVersion: revBB, Aug-2009

## Nets that join several sheets
+3V3_CTRL: 03_Control (23 pins), 01_Alimentacion (C2.2 U1.3)
+5V_A: 02_Entrada_Guitarra (C5.1 R3.2 U2.8), 01_Alimentacion (C3.1 R2.1)
+5V_AMP: 04_Interfaces_Audio (JP8.4), 01_Alimentacion (JP2.2)
+5V_TSA: 04_Interfaces_Audio (J4.1), 01_Alimentacion (JP1.2)
GND: 02_Entrada_Guitarra (6 pins), 04_Interfaces_Audio (6 pins), 03_Control (28 pins), 01_Alimentacion (7 pins)
NetC8_2: 02_Entrada_Guitarra (C8.2 R12.2), 04_Interfaces_Audio (JP7.1)
NetJP4_2: 04_Interfaces_Audio (JP6.2), 03_Control (JP4.2)
NetJP5_2: 04_Interfaces_Audio (JP6.3), 03_Control (JP5.2)